# Altium schematic sheet [06] - REVISION HISTORY.SchDoc
size A3; DocumentNumber: 3; SheetNumber: 3; SheetTotal: 4
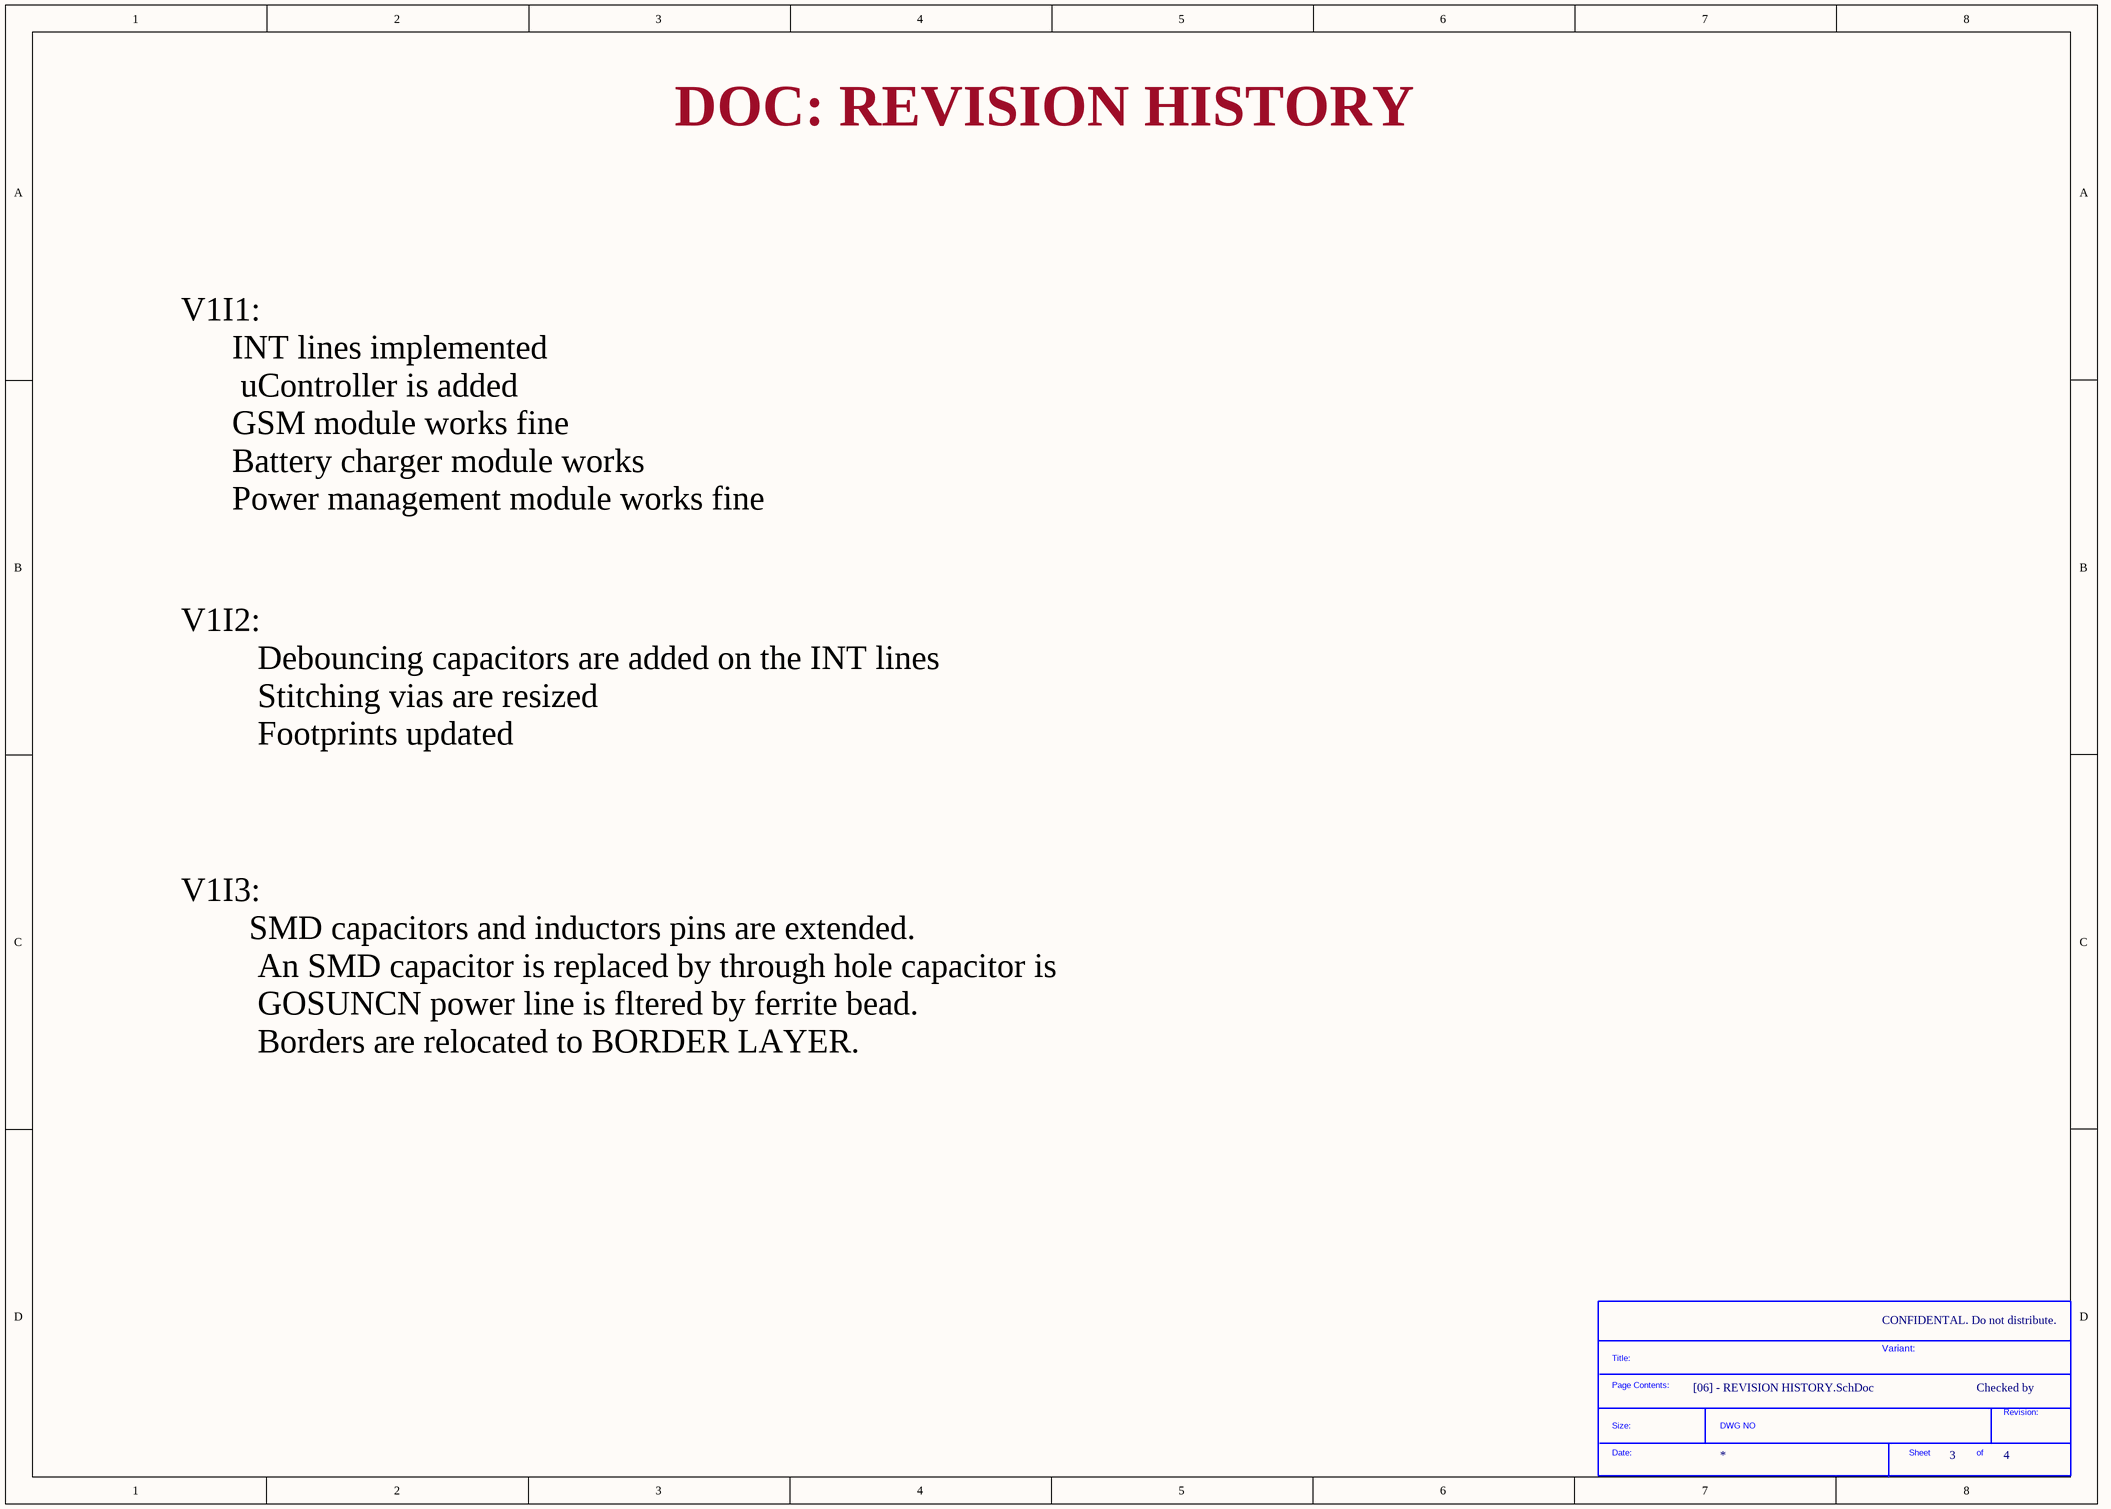
[diagram p0: [06] - REVISION HISTORY.SchDoc]

## Parts
*  SDTitleBlock  (value not drawn)  (graphical)

## Notes on the sheet
- DOC: REVISION HISTORY
- V1I1:
  INT lines implemented
  uController is added
  GSM module works fine
  Battery charger module works
  Power management module works fine
- V1I2:
  Debouncing capacitors are added on the INT lines
  Stitching vias are resized
  Footprints updated
- V1I3:
  SMD capacitors and inductors pins are extended.
  An SMD capacitor is replaced by through hole capacitor is
  GOSUNCN power line is fltered by ferrite bead.
  Borders are relocated to BORDER LAYER.
- CONFIDENTAL. Do not distribute.
- CLOCKS (CPU & PCIE)
- Variant:
- Checked by
- (in symbol SDTitleBlock) Title:; Page Contents:; Revision:; Size:; DWG NO; Date:; Sheet; of